# Altium project Control-Board-v4.0.PrjPcb (part 1 of 2)
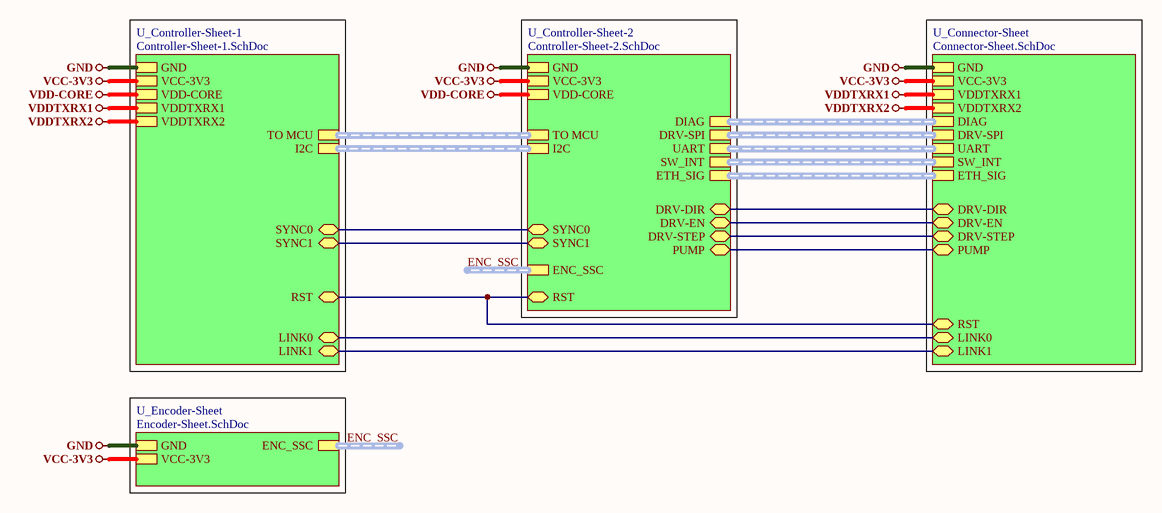
[diagram p0: Top-Sheet.SchDoc]
5 sheets, 81 parts. Net scope: hierarchical (ports join the sheet entries above them; power ports are global).
Board file: Control-Board-v4.0.PcbDoc
Sheets:
  Top-Sheet.SchDoc
    U_Controller-Sheet-1 = Controller-Sheet-1.SchDoc
    U_Controller-Sheet-2 = Controller-Sheet-2.SchDoc
    U_Encoder-Sheet = Encoder-Sheet.SchDoc
    U_Connector-Sheet = Connector-Sheet.SchDoc

## Sheet Top-Sheet.SchDoc
size A4; SheetNumber: 1; SheetTotal: 5

### Sub-sheets
U_Connector-Sheet = Connector-Sheet.SchDoc: VDDTXRX2, GND, VDDTXRX1, VCC-3V3, DIAG (harness DIAG), DRV-SPI (harness DRV-SPI), UART (harness UART), SW_INT (harness SW_INT), DRV-STEP (bidir), DRV-DIR (bidir), DRV-EN (bidir), PUMP (bidir), ETH_SIG (harness ETH_SIG), LINK0 (bidir), LINK1 (bidir), RST (bidir)
U_Controller-Sheet-1 = Controller-Sheet-1.SchDoc: GND, VCC-3V3, TO MCU (harness To MCU), I2C (harness I2C), VDDTXRX2, VDDTXRX1, RST (bidir), SYNC0 (bidir), SYNC1 (bidir), LINK0 (bidir), LINK1 (bidir), VDD-CORE
U_Controller-Sheet-2 = Controller-Sheet-2.SchDoc: ETH_SIG (harness ETH_SIG), ENC_SSC (harness ENC_SSC), SW_INT (harness SW_INT), TO MCU (harness To MCU), UART (harness UART), GND, VCC-3V3, I2C (harness I2C), SYNC0 (bidir), SYNC1 (bidir), RST (bidir), VDD-CORE, DIAG (harness DIAG), DRV-STEP (bidir), DRV-DIR (bidir), DRV-EN (bidir), DRV-SPI (harness DRV-SPI), PUMP (bidir)
U_Encoder-Sheet = Encoder-Sheet.SchDoc: GND, VCC-3V3, ENC_SSC (harness ENC_SSC)

### Nets
GND: sheet U_Controller-Sheet-1/GND, sheet U_Controller-Sheet-2/GND, sheet U_Encoder-Sheet/GND, sheet U_Connector-Sheet/GND
VCC-3V3: sheet U_Controller-Sheet-1/VCC-3V3, sheet U_Controller-Sheet-2/VCC-3V3, sheet U_Encoder-Sheet/VCC-3V3, sheet U_Connector-Sheet/VCC-3V3
VDD-CORE: sheet U_Controller-Sheet-1/VDD-CORE, sheet U_Controller-Sheet-2/VDD-CORE
VDDTXRX1: sheet U_Controller-Sheet-1/VDDTXRX1, sheet U_Connector-Sheet/VDDTXRX1
VDDTXRX2: sheet U_Controller-Sheet-1/VDDTXRX2, sheet U_Connector-Sheet/VDDTXRX2
DRV-DIR: sheet U_Controller-Sheet-2/DRV-DIR, sheet U_Connector-Sheet/DRV-DIR
DRV-EN: sheet U_Controller-Sheet-2/DRV-EN, sheet U_Connector-Sheet/DRV-EN
DRV-STEP: sheet U_Controller-Sheet-2/DRV-STEP, sheet U_Connector-Sheet/DRV-STEP
LINK0: sheet U_Controller-Sheet-1/LINK0, sheet U_Connector-Sheet/LINK0
LINK1: sheet U_Controller-Sheet-1/LINK1, sheet U_Connector-Sheet/LINK1
PUMP: sheet U_Controller-Sheet-2/PUMP, sheet U_Connector-Sheet/PUMP
RST: sheet U_Controller-Sheet-1/RST, sheet U_Controller-Sheet-2/RST, sheet U_Connector-Sheet/RST
SYNC0: sheet U_Controller-Sheet-1/SYNC0, sheet U_Controller-Sheet-2/SYNC0
SYNC1: sheet U_Controller-Sheet-1/SYNC1, sheet U_Controller-Sheet-2/SYNC1

### Buses and harness runs
harness ENC_SSC = sheet U_Controller-Sheet-2/ENC_SSC
harness ENC_SSC = sheet U_Encoder-Sheet/ENC_SSC
harness sheet U_Connector-Sheet/DIAG = sheet U_Controller-Sheet-2/DIAG
harness sheet U_Connector-Sheet/DRV-SPI = sheet U_Controller-Sheet-2/DRV-SPI
harness sheet U_Connector-Sheet/ETH_SIG = sheet U_Controller-Sheet-2/ETH_SIG
harness sheet U_Connector-Sheet/SW_INT = sheet U_Controller-Sheet-2/SW_INT
harness sheet U_Connector-Sheet/UART = sheet U_Controller-Sheet-2/UART
harness sheet U_Controller-Sheet-1/I2C = sheet U_Controller-Sheet-2/I2C
harness sheet U_Controller-Sheet-1/TO MCU = sheet U_Controller-Sheet-2/TO MCU

### Notes on the sheet
- File:
- Title:
- Date:
- Page
- Num:
- Total:
- Drawn By: Huzaifa Ali

## Sheet Controller-Sheet-1.SchDoc
size A4; SheetNumber: 2; SheetTotal: 5
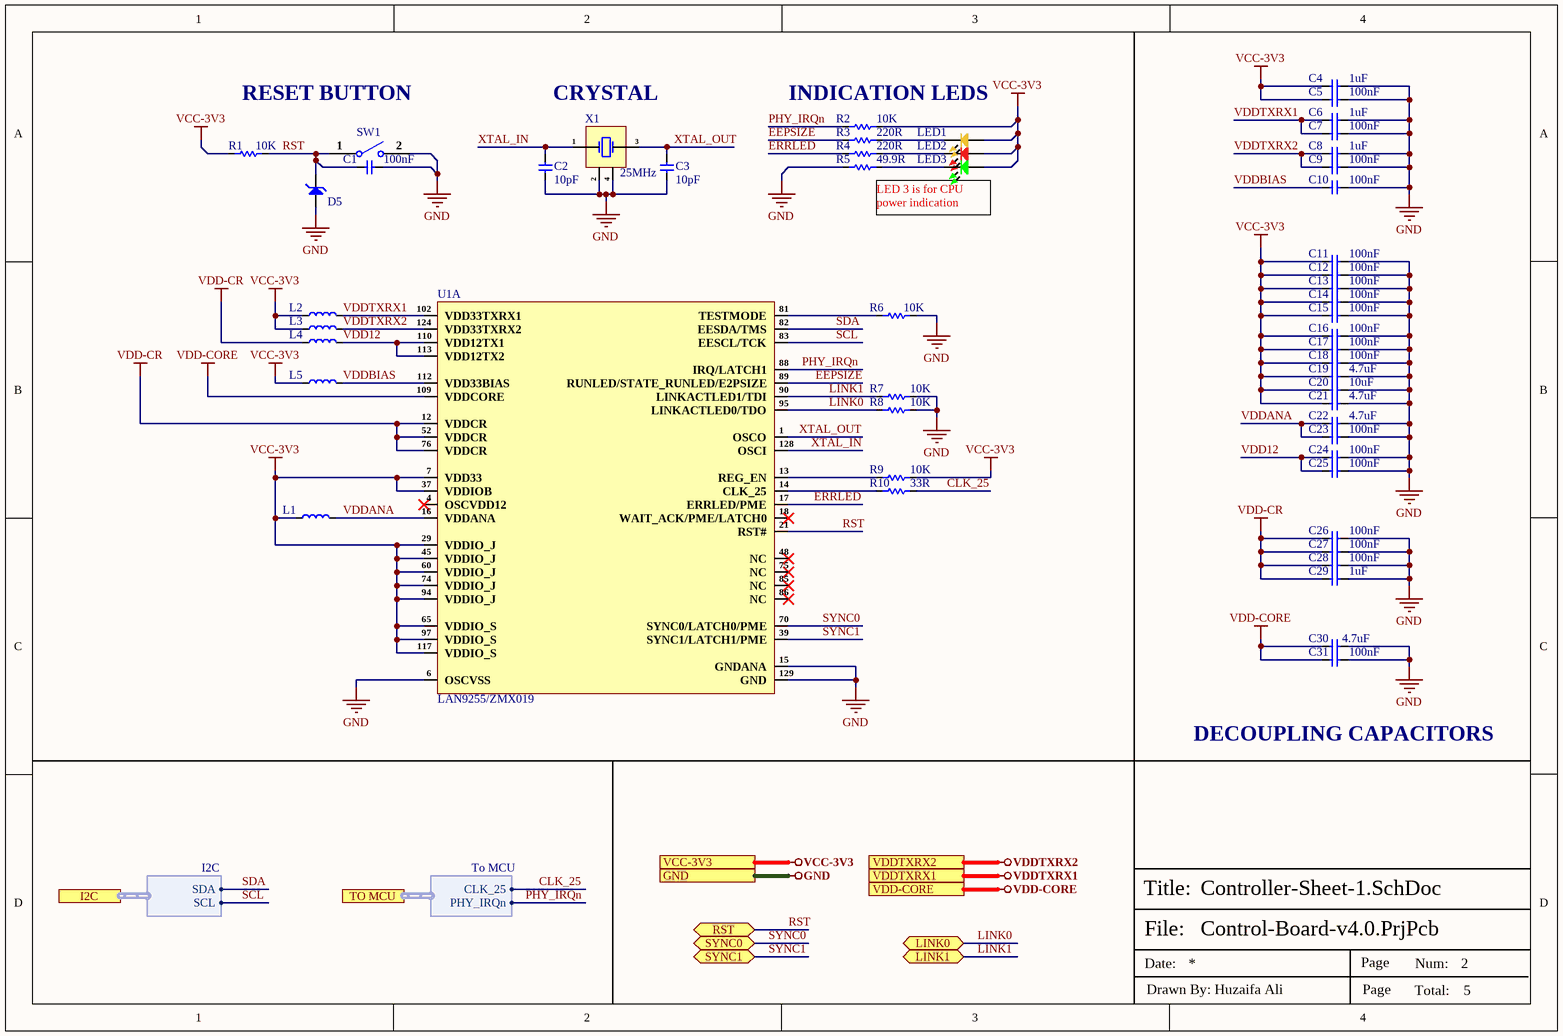
[diagram p1: Controller-Sheet-1.SchDoc]

### Parts
C1  100nF  [CAP-0201]
C2  10pF  [CAP-0201]
C3  10pF  [CAP-0201]
C4  1uF  [CAP-0201]
C5  100nF  [CAP-0201]
C6  1uF  [CAP-0201]
C7  100nF  [CAP-0201]
C8  1uF  [CAP-0201]
C9  100nF  [CAP-0201]
C10  100nF  [CAP-0201]
C11  100nF  [CAP-0201]
C12  100nF  [CAP-0201]
C13  100nF  [CAP-0201]
C14  100nF  [CAP-0201]
C15  100nF  [CAP-0201]
C16  100nF  [CAP-0201]
C17  100nF  [CAP-0201]
C18  100nF  [CAP-0201]
C19  4.7uF  [Cap-0402]
C20  10uF  [Cap-0402]
C21  4.7uF  [Cap-0402]
C22  4.7uF  [Cap-0402]
C23  100nF  [CAP-0201]
C24  100nF  [CAP-0201]
C25  100nF  [CAP-0201]
C26  100nF  [CAP-0201]
C27  100nF  [CAP-0201]
C28  100nF  [CAP-0201]
C29  1uF  [CAP-0201]
C30  4.7uF  [Cap-0402]
C31  100nF  [CAP-0201]
D5  PESDHC3D3V3U  [SOD-323]  (value not drawn)
L1  MLB1608-201P1A(f)  [IND-0603 (1608 Metric)]  (value not drawn)
L2  MLB1608-201P1A(f)  [IND-0603 (1608 Metric)]  (value not drawn)
L3  MLB1608-201P1A(f)  [IND-0603 (1608 Metric)]  (value not drawn)
L4  MLB1608-201P1A(f)  [IND-0603 (1608 Metric)]  (value not drawn)
L5  MLB1608-201P1A(f)  [IND-0603 (1608 Metric)]  (value not drawn)
LED1  Yellow  [LED-0603]  (value not drawn)
LED2  RED  [LED-0603]  (value not drawn)
LED3  Emerald  [LED-0603]  (value not drawn)
R1  10K  [Res-0201]
R2  10K  [Res-0201]
R3  220R  [Res-0201]
R4  220R  [Res-0201]
R5  49.9R  [Res-0201]
R6  10K  [Res-0201]
R7  10K  [Res-0201]
R8  10K  [Res-0201]
R9  10K  [Res-0201]
R10  33R  [Res-0402]
SW1  B3U-1000P  [B3U-1000P]  (value not drawn)
U1  LAN9255/ZMX019  [LAN9255/ZMX019]  (part A of 3)
X1  25MHz  [ABM10AIG-25.000MHZ-4Z-T3]

### Ports
GND (see Top-Sheet[1A], Connector-Sheet[3D], Controller-Sheet-2[3D], Encoder-Sheet[3D]), I2C (harness I2C, see Top-Sheet[2B], Controller-Sheet-2[1D]), LINK0 (bidir, see Top-Sheet[2C], Connector-Sheet[1D]), LINK1 (bidir, see Top-Sheet[2C], Connector-Sheet[1D]), RST (bidir, see Top-Sheet[2B], Connector-Sheet[1D], Controller-Sheet-2[3D]), SYNC0 (bidir, see Top-Sheet[2B], Controller-Sheet-2[3D]), SYNC1 (bidir, see Top-Sheet[2B], Controller-Sheet-2[3D]), TO MCU (harness To MCU, see Top-Sheet[2B], Controller-Sheet-2[1D]), VCC-3V3 (see Top-Sheet[1B], Connector-Sheet[3D], Controller-Sheet-2[3D], Encoder-Sheet[2D]), VDD-CORE (see Top-Sheet[1B], Controller-Sheet-2[3D]), VDDTXRX1 (see Top-Sheet[1B], Connector-Sheet[3D]), VDDTXRX2 (see Top-Sheet[1B], Connector-Sheet[3D])

### Harnesses
To MCU: CLK_25, PHY_IRQn
I2C: SDA, SCL

### Nets
GND: C1.2 C2.1 C3.1 C4.2 C5.2 C6.2 C7.2 C8.2 C9.2 C10.2 C11.2 C12.2 C13.2 C14.2 C15.2 C16.2 C17.2 C18.2 C19.2 C20.2 C21.2 C22.2 C23.2 C24.2 C25.2 C26.2 C27.2 C28.2 C29.2 C30.2 C31.2 D5.2(A) R5.1 R6.2 R7.2 R8.2 SW1.2 U1.6(OSCVSS) U1.15(GNDANA) U1.129(GND) X1.2(GND) X1.4(GND) ; port GND
VCC-3V3: C4.1 C5.1 C11.1 C12.1 C13.1 C14.1 C15.1 C16.1 C17.1 C18.1 C19.1 C20.1 C21.1 L1.1 L2.1 L3.1 L5.1 LED1.1 LED2.1 LED3.1 R1.1 R2.2 R9.2 U1.7(VDD33) U1.29(VDDIO_J) U1.37(VDDIOB) U1.45(VDDIO_J) U1.60(VDDIO_J) U1.65(VDDIO_S) U1.74(VDDIO_J) U1.94(VDDIO_J) U1.97(VDDIO_S) U1.117(VDDIO_S) ; port VCC-3V3
VDD-CORE: C30.1 C31.1 U1.109(VDDCORE) ; port VDD-CORE
VDD-CR: C26.1 C27.1 C28.1 C29.1 L4.1 U1.12(VDDCR) U1.52(VDDCR) U1.76(VDDCR)
VDDTXRX1: C6.1 C7.1 L2.2 U1.102(VDD33TXRX1) ; port VDDTXRX1
VDDTXRX2: C8.1 C9.1 L3.2 U1.124(VDD33TXRX2) ; port VDDTXRX2
CLK_25: R10.2 ; port TO MCU.CLK_25
EEPSIZE: R3.1 U1.89(RUNLED/STATE_RUNLED/E2PSIZE)
ERRLED: R4.1 U1.17(ERRLED/PME)
LINK0: R8.1 U1.95(LINKACTLED0/TDO) ; port LINK0
LINK1: R7.1 U1.90(LINKACTLED1/TDI) ; port LINK1
PHY_IRQn: R2.1 U1.88(IRQ/LATCH1) ; port TO MCU.PHY_IRQn
RST: C1.1 D5.1(C) R1.2 SW1.1 U1.21(RST#) ; port RST
SCL: U1.83(EESCL/TCK) ; port I2C.SCL
SDA: U1.82(EESDA/TMS) ; port I2C.SDA
SYNC0: U1.70(SYNC0/LATCH0/PME) ; port SYNC0
SYNC1: U1.39(SYNC1/LATCH1/PME) ; port SYNC1
VDD12: C24.1 C25.1 L4.2 U1.110(VDD12TX1) U1.113(VDD12TX2)
VDDANA: C22.1 C23.1 L1.2 U1.16(VDDANA)
VDDBIAS: C10.1 L5.2 U1.112(VDD33BIAS)
XTAL_IN: C2.2 U1.128(OSCI) X1.1(OSC1)
XTAL_OUT: C3.2 U1.1(OSCO) X1.3(OSC2)
NetLED1_2: LED1.2 R3.2
NetLED2_2: LED2.2 R4.2
NetLED3_2: LED3.2 R5.2
NetR6_1: R6.1 U1.81(TESTMODE)
NetR9_1: R9.1 U1.13(REG_EN)
NetR10_1: R10.1 U1.14(CLK_25)

Not connected (* = marked no-connect by the designer): U1 4(OSCVDD12)* 18(WAIT_ACK/PME/LATCH0)* 48(NC)* 75(NC)* 85(NC)* 86(NC)*

### Notes on the sheet
- RESET BUTTON
- CRYSTAL
- INDICATION LEDS
- LED 3 is for CPU power indication
- DECOUPLING CAPACITORS
- File:
- Title:
- Date:
- Page
- Num:
- Total:
- Drawn By: Huzaifa Ali

### Library data of the parts
C1 C5 C7 C9-C18 C23-C28 C31 = CC0201KRX5R6BB104: CAP CER 0.1UF 10V X5R 0201; Manufacturer: Yageo; Tolerance: 10%; Supplier 1: Mouser; Manufacturer Part Number: CC0201KRX5R6BB104; RoHS: Yes; Category: Ceramic Capacitors; Stock 1: 824403; Pricing 1: 1=0.10000, 10=0.02400, 50=0.02400, 100=0.01900, 1000=0.01100, 10000=0.00900 (USD); Mount: Surface Mount; Case/Package: 0201; Case Code (Imperial): 0201; Case Code (Metric): 0603; Weight: 6E-06oz; Min Operating Temperature: -55°C; Max Operating Temperature: 85°C; Capacitance: 100nF; Dielectric: X5R; Voltage Rating (DC): 10V; Packaging: Tape and Reel; Termination: SMD/SMT; Resistor Type: Ceramic; Voltage Rating: 10V; Series: CC; Construction: Flat; Length: 0.6mm; Width: 0.012inch; Height: 0.3mm; Thickness: 0.013inch; Depth: 0.3mm; Radiation Hardening: No; Lead Free: Lead Free; Halogen Free: Halogen Free; RoHS Compliant: Yes; ComponentLink1URL: https://datasheet.ciiva.com/11587/upy-gphc-x5r-4v-to-50v-12-11587190.pdf?src-supplier=Avnet; ComponentLink1Description: https://datasheet.ciiva.com/11587/upy-gphc-x5r-4v-to-50v-12-11587190.pdf?src-supplier=Avnet; Supplier Part Number 1: 603-CC201KRX5R6BB104; LCSC Part Number: C190183
C2 C3 = CGA1A2C0G1E100D030BA: CAP CER 10PF 25V C0G 0201; Manufacturer: TDK; Item Type: Capacitor; Supplier 1: Digi-Key; Manufacturer Part Number: CGA1A2C0G1E100D030BA; RoHS: Yes; Category: Ceramic Capacitors; Stock 1: 28695; Pricing 1: 1=0.11000, 10=0.07900, 50=0.04340, 100=0.03540, 500=0.02530, 1000=0.01987, 2500=0.01807, 5000=0.01662 (USD); Mount: Surface Mount; Case/Package: 0201; Case Code (Imperial): 0201; Case Code (Metric): 0603; Weight: 6E-06oz; Min Operating Temperature: -55°C; Max Operating Temperature: 125°C; Packaging: Tape and Reel; Capacitance: 10pF; Voltage Rating: 25V; Termination: SMD/SMT; Voltage Rating (DC): 25V; Package Quantity: 1; Dielectric: C0G; Resistor Type: Ceramic; Series: CGA; Length: 0.6mm; Width: 0.3mm; Height: 0.3mm; Thickness: 0.013inch; Depth: 0.3mm; Ratings: AEC-Q200; RoHS Compliant: Yes; ComponentLink1URL: https://datasheet.ciiva.com/24220/cga1a2c0g1e100d030ba-271838-24220873.pdf?src-supplier=Mouser; ComponentLink1Description: https://datasheet.ciiva.com/24220/cga1a2c0g1e100d030ba-271838-24220873.pdf?src-supplier=Mouser; Supplier Part Number 1: 445-9023-1-ND; LCSC Part Number: C2168728
C4 C6 C8 C29 = CC0201MRX5R6BB105: CAP CER 1UF 10V X5R 0201; Manufacturer: Yageo; Item Type: Capacitor; Supplier: Digi-Key; Supplier Part Number: 311-3474-1-ND; Manufacturer Part Number: CC0201MRX5R6BB105; RoHS: Yes; Category: Ceramic Capacitors; Stock: 772400; Pricing: 1=0.19, 10=0.135, 50=0.0764, 100=0.0633, 500=0.04436, 1000=0.03672, 2500=0.03418, 5000=0.03127 (USD); ComponentLink1URL: https://datasheet.octopart.com/CC0201MRX5R6BB105-Yageo-datasheet-158238148.pdf?src-supplier=Farnell; ComponentLink1Description: https://datasheet.octopart.com/CC0201MRX5R6BB105-Yageo-datasheet-158238148.pdf?src-supplier=Farnell; ComponentLink2URL: http://www.yageo.com/documents/recent/UPY-GPHC_X5R_4V-to-50V_25.pdf?src-supplier=Digi-Key; ComponentLink2Description: http://www.yageo.com/documents/recent/UPY-GPHC_X5R_4V-to-50V_25.pdf?src-supplier=Digi-Key; ComponentLink3URL: https://datasheet.octopart.com/CC0201MRX5R6BB105-Yageo-datasheet-137700082.pdf?src-supplier=Future+Electronics; ComponentLink3Description: https://datasheet.octopart.com/CC0201MRX5R6BB105-Yageo-datasheet-137700082.pdf?src-supplier=Future+Electronics; LCSC Part Number: C605210
C19 C21 C22 C30 = CC0402KRX5R6BB475: CAP CER 4.7UF 10V X5R 0402; Manufacturer: Yageo; Tolerance: 10%; Supplier 1: Farnell; Manufacturer Part Number: CC0402KRX5R6BB475; RoHS: Yes; Category: Ceramic Capacitors; Stock 1: 20000; Pricing 1: 10000=0.02310, 50000=0.02100 (GBP); Mount: Surface Mount; Case/Package: 0402; Case Code (Imperial): 0402; Case Code (Metric): 1005; Min Operating Temperature: -55°C; Max Operating Temperature: 85°C; Packaging: Cut Tape; Capacitance: 4.7uF; Voltage Rating: 10V; RoHS Compliant: Yes; ComponentLink1URL: http://www.yageo.com/documents/recent/UPY-GPHC_X5R_4V-to-50V_25.pdf?src-supplier=Digi-Key; ComponentLink1Description: http://www.yageo.com/documents/recent/UPY-GPHC_X5R_4V-to-50V_25.pdf?src-supplier=Digi-Key; Supplier Part Number 1: 3871698; LCSC Part Number: C326586
C20 = CL05A106MP5NUNC: CAP CER 10UF 10V X5R 0402; Manufacturer: Samsung; Tolerance: 20%; Item Type: Capacitor; Supplier 1: Avnet; Manufacturer Part Number: CL05A106MP5NUNC; RoHS: Yes; Category: Ceramic Capacitors; Stock 1: 1729850; Pricing 1: 10000=0.02537 (USD); Mount: Surface Mount; Case/Package: 0402; Case Code (Metric): 1005; Case Code (Imperial): 0402; Contact Plating: Tin; Min Operating Temperature: -55°C; Max Operating Temperature: 85°C; Package Quantity: 1; Packaging: Tape and Reel; Capacitance: 10uF; Voltage Rating: 10V; Dielectric: X5R; Termination: Wraparound; Series: CL; Construction: Flat; Length: 1mm; Width: 0.02inch; Thickness: 0.028inch; Depth: 0.5mm; Radiation Hardening: No; Lead Free: Lead Free; RoHS Compliant: Yes; ComponentLink1URL: https://datasheet.ciiva.com/25721/cl05a106mp5nunc-25721584.pdf?src-supplier=Digi-Key; ComponentLink1Description: https://datasheet.ciiva.com/25721/cl05a106mp5nunc-25721584.pdf?src-supplier=Digi-Key; ComponentLink2URL: https://datasheet.ciiva.com/26838/getdatasheetpartid-745310-26838170.pdf?src-supplier=Verical; ComponentLink2Description: https://datasheet.ciiva.com/26838/getdatasheetpartid-745310-26838170.pdf?src-supplier=Verical; Supplier Part Number 1: CL05A106MP5NUNC; LCSC Part Number: C315248
D5 = PESDHC3D3V3U: 15A@8/20us 9V 5V 3.3V Unidirectional SOD-323 TVS ROHS; Manufacturer: Shanghai Prisemi Elec; Item Type: Diode; Manufacturer Part Number: PESDHC3D3V3U; Package: SOD-323; LCSC Part Number: C496538; ComponentLink1Description: LCSC; ComponentLink1URL: https://www.lcsc.com/product-detail/TVS_Shanghai-Prisemi-Elec-PESDHC3D3V3U_C496538.html
L1-L5 = MLB1608-201P1A(f): 200Ω @ 100MHz 1 1A 300mΩ 0603 Ferrite Beads; Manufacturer: Meled; Number of Lines: 1; Impedance @ Frequency: 200Ω @ 100MHz; Current Rating (Max): 1A; DC Resistance (DCR) (Max): 300mΩ; ComponentLink1Description: LCSC; ComponentLink1URL: https://www.lcsc.com/product-detail/Ferrite-Beads_Meled-MLB1608-201P1A-f_C45316.html
LED1 = NCD0603Y2: yellow 0603 Light Emitting Diodes (LED) ROHS; Manufacturer: Foshan NationStar Optoelectronics; Manufacturer Part Number: NCD0603Y2; Package: 0603; LCSC Part Number: C89811; Item Type: LED; ComponentLink1Description: LCSC; ComponentLink1URL: https://www.lcsc.com/product-detail/Light-Emitting-Diodes-LED_Foshan-NationStar-Optoelectronics-NCD0603Y2_C89811.html
LED2 = NCD0603R3: RED LED 0603 Light Emitting Diodes; Manufacturer: Foshan NationStar Optoelectronics; Manufacturer Part Number: NCD0603R3; Package: 0603; Item Type: LED; LCSC Part Number: C3151730; ComponentLink1Description: LCSC; ComponentLink1URL: https://www.lcsc.com/product-detail/Light-Emitting-Diodes-LED_Foshan-NationStar-Optoelectronics-NCD0603R3_C3151730.html
LED3 = NCD0603G2: Emerald 0603 Light Emitting Diodes (LED) ROHS; Manufacturer: Foshan NationStar Optoelectronics; Manufacturer Part Number: NCD0603G2; Package: 0603; LCSC Part Number: C87326; Item Type: LED; ComponentLink1Description: LCSC; ComponentLink1URL: https://www.lcsc.com/product-detail/Light-Emitting-Diodes-LED_Foshan-NationStar-Optoelectronics-NCD0603G2_C87326.html
R1 R2 R6-R9 = RC0201FR-0710KL: RES SMD 10K OHM 1% 1/20W 0201; Manufacturer: Yageo; Item Type: Resistor; Manufacturer Part Number: RC0201FR-0710KL; Package: 0201; ComponentLink7Description: LCSC; ComponentLink7URL: https://www.lcsc.com/product-detail/Chip-Resistor-Surface-Mount_YAGEO-RC0201FR-0710KL_C106225.html; LCSC Part Number: C106225
R3 R4 = RC0201FR-07220RL: RES 220 OHM 1% 1/20W 0201; Manufacturer: Yageo; Temperature Coefficient: 200ppm/°C; Power Rating: 50mW; Voltage Rating: 25V; Supplier 1: Digi-Key; Manufacturer Part Number: RC0201FR-07220RL; RoHS: Yes; Category: Chip SMD Resistors; Stock 1: 189347; Pricing 1: 1=0.10000, 10=0.03600, 100=0.01480, 1000=0.00665, 2500=0.00577, 5000=0.00477 (USD); Case/Package: 0201; Contact Plating: Tin,Matte; Case Code (Imperial): 0201; Case Code (Metric): 0603; Min Operating Temperature: -55°C; Max Operating Temperature: 125°C; Resistance: 220R; Tolerance: 1%; Resistor Type: Thick Film; Packaging: Tape and Reel; Features: Moisture Resistant; Max Power Dissipation: 50mW; Number of Terminations: 2; Termination: SMD/SMT; Length: 0.6mm; Width: 0.012inch; Height: 0.01inch; Depth: 0.3mm; Radiation Hardening: No; REACH SVHC: Unknown; Military Standard: Not; ComponentLink1URL: https://datasheet.ciiva.com/7672/1563626-7672213.pdf?src-supplier=Element14; ComponentLink1Description: https://datasheet.ciiva.com/7672/1563626-7672213.pdf?src-supplier=Element14; ComponentLink2URL: https://datasheet.ciiva.com/8886/pyu-rc0201-51-rohs-l-8-8886758.pdf?src-supplier=Avnet; ComponentLink2Description: https://datasheet.ciiva.com/8886/pyu-rc0201-51-rohs-l-8-8886758.pdf?src-supplier=Avnet; ComponentLink3URL: https://datasheet.ciiva.com/16855/pyu-rc0201-51-rohs-l-8-16855847.pdf?src-supplier=Avnet+Europe; ComponentLink3Description: https://datasheet.ciiva.com/16855/pyu-rc0201-51-rohs-l-8-16855847.pdf?src-supplier=Avnet+Europe; ComponentLink4URL: https://datasheet.ciiva.com/28393/pyu-rc0201-51-rohs-l-8-28393063.pdf?src-supplier=Avnet+Europe; ComponentLink4Description: https://datasheet.ciiva.com/28393/pyu-rc0201-51-rohs-l-8-28393063.pdf?src-supplier=Avnet+Europe; Supplier Part Number 1: YAG2509CT-ND; LCSC Part Number: C274342
R5 = RC0201FR-0749R9L: RES SMD 49.9 OHM 1% 1/20W 0201; Manufacturer: Yageo; Power Rating: 50mW; Voltage Rating: 25V; Temperature Coefficient: 200ppm/°C; Item Type: Resistor; Supplier 1: Avnet; Manufacturer Part Number: RC0201FR-0749R9L; RoHS: Yes; Category: Chip SMD Resistors; Stock 1: 1020000; Pricing 1: 10000=0.00128 (USD); Case/Package: 0201; Case Code (Imperial): 0201; Case Code (Metric): 0603; Size Code: 0201; Min Operating Temperature: -55°C; Max Operating Temperature: 125°C; Packaging: Tape and Reel; Resistance: 49.9R; Tolerance: 1%; Resistor Type: Thick Film; Number of Terminations: 2; Termination: SMD/SMT; Max Power Dissipation: 50mW; Features: Moisture Resistant; Series: RC; Construction: Rectangular; Length: 0.6mm; Width: 0.012inch; Height: 0.01inch; Depth: 0.3mm; Military Standard: Not; Lead Free: Lead Free; RoHS Compliant: Yes; ComponentLink1URL: http://www.yageo.com/documents/recent/PYu-RC0201_51_RoHS_L_(8).pdf?src-supplier=Mouser; ComponentLink1Description: http://www.yageo.com/documents/recent/PYu-RC0201_51_RoHS_L_(8).pdf?src-supplier=Mouser; ComponentLink2URL: http://www.yageo.com/documents/recent/PYu-RC0201_51_RoHS_L_(8).pdf?src-supplier=Future+Electronics; ComponentLink2Description: http://www.yageo.com/documents/recent/PYu-RC0201_51_RoHS_L_(8).pdf?src-supplier=Future+Electronics; ComponentLink3URL: http://www.yageo.com/documents/recent/PYu-RC_Group_51_RoHS_L_10.pdf?src-supplier=Digi-Key; ComponentLink3Description: http://www.yageo.com/documents/recent/PYu-RC_Group_51_RoHS_L_10.pdf?src-supplier=Digi-Key; ComponentLink4URL: http://www.yageo.com/documents/recent/PYu-RC_Group_51_RoHS_L_9.pdf?src-supplier=Digi-Key; ComponentLink4Description: http://www.yageo.com/documents/recent/PYu-RC_Group_51_RoHS_L_9.pdf?src-supplier=Digi-Key; Supplier Part Number 1: RC0201FR-0749R9L; LCSC Part Number: C155744
R10 = RC0402FR-0733RL: RES 33 OHM 1% 1/16W 0402; Manufacturer: Yageo; Power Rating: 62.5mW; Voltage Rating: 50V; Temperature Coefficient: 100ppm/°C; Max Power Dissipation: 63mW; Supplier 1: Mouser; Manufacturer Part Number: RC0402FR-0733RL; RoHS: Yes; Category: Chip SMD Resistors; Stock 1: 1843488; Pricing 1: 1=0.10000, 10=0.01200, 50=0.01200, 100=0.00500, 1000=0.00300, 10000=0.00100 (USD); Case/Package: 0402; Number of Pins: 2; Case Code (Imperial): 0402; Case Code (Metric): 1005; Size Code: 0402; Min Operating Temperature: -55°C; Max Operating Temperature: 155°C; Resistor Type: Thick Film; Resistance: 33R; Tolerance: 1%; Packaging: Tape and Reel; Voltage Rating (DC): 50V; Package Quantity: 10000; Termination: SMD/SMT; Features: Moisture Resistant; Series: RC; Number of Terminations: 2; Resistance Tolerance: 1%; Construction: Rectangular; Technology: THICK FILM; Length: 1mm; Width: 0.5mm; Height: 0.35mm; Depth: 0.5mm; RoHS Compliant: Yes; REACH SVHC: Unknown; Military Standard: Not; Lead Free: Lead Free; ComponentLink1URL: https://datasheet.ciiva.com/11819/0900766b80c66297-11819487.pdf?src-supplier=RSComponents; ComponentLink1Description: https://datasheet.ciiva.com/11819/0900766b80c66297-11819487.pdf?src-supplier=RSComponents; ComponentLink2URL: https://datasheet.ciiva.com/24070/pyu-rc0402-51-rohs-l-6-r-8721-24070077.pdf?src-supplier=Mouser; ComponentLink2Description: https://datasheet.ciiva.com/24070/pyu-rc0402-51-rohs-l-6-r-8721-24070077.pdf?src-supplier=Mouser; ComponentLink3URL: https://datasheet.ciiva.com/7849/1018594-7849967.pdf?src-supplier=Element14; ComponentLink3Description: https://datasheet.ciiva.com/7849/1018594-7849967.pdf?src-supplier=Element14; ComponentLink4URL: https://datasheet.ciiva.com/7849/1018594-7849966.pdf?src-supplier=Element14; ComponentLink4Description: https://datasheet.ciiva.com/7849/1018594-7849966.pdf?src-supplier=Element14; ComponentLink5URL: https://datasheet.ciiva.com/15189/getdatasheetpartid-329253-15189431.pdf?src-supplier=Verical; ComponentLink5Description: https://datasheet.ciiva.com/15189/getdatasheetpartid-329253-15189431.pdf?src-supplier=Verical; ComponentLink6URL: https://datasheet.ciiva.com/17070/pyu-rc0402-51-rohs-l-6-r-17070335.pdf?src-supplier=Future+Electronics; ComponentLink6Description: https://datasheet.ciiva.com/17070/pyu-rc0402-51-rohs-l-6-r-17070335.pdf?src-supplier=Future+Electronics; Supplier Part Number 1: 603-RC0402FR-0733RL; LCSC Part Number: C138002
SW1 = B3U-1000P: SWITCH TACTILE SPST-NO 0.05A 12V; Manufacturer: Omron; Mechanical Life: 200000Cycles; Operating Force: 1.5N; Throw Configuration: SPST; Current Rating: 50mA; Contact Resistance: 100mR; Illumination Type: Non-Illuminated,Illuminated; Switch Travel: 0.15mm; Switch Function: Off-Mom; Actuator Type: Standard; Actuator Length: 0.4mm; Ratings: Dust Proof,IP40; ComponentLink1URL: http://www.farnell.com/datasheets/60838.pdf?src-supplier=Farnell; ComponentLink1Description: http://www.farnell.com/datasheets/60838.pdf?src-supplier=Farnell; ComponentLink2URL: http://www.farnell.com/datasheets/60838.pdf?src-supplier=Element14; ComponentLink2Description: http://www.farnell.com/datasheets/60838.pdf?src-supplier=Element14; ComponentLink3URL: https://omronfs.omron.com/en_US/ecb/products/pdf/en-b3u.pdf?src-supplier=Digi-Key; ComponentLink3Description: https://omronfs.omron.com/en_US/ecb/products/pdf/en-b3u.pdf?src-supplier=Digi-Key; ComponentLink4URL: http://www.omron.com/ecb/products/pdf/en-b3u.pdf?src-supplier=Digi-Key; ComponentLink4Description: http://www.omron.com/ecb/products/pdf/en-b3u.pdf?src-supplier=Digi-Key; ComponentLink5URL: https://www.distrelec.biz/Web/Downloads/he/et/B3U_eng_datasheet.pdf?mime=application%2Fpdf&src-supplier=Distrelec; ComponentLink5Description: https://www.distrelec.biz/Web/Downloads/he/et/B3U_eng_datasheet.pdf?mime=application%2Fpdf&src-supplier=Distrelec; ComponentLink6URL: http://www.onlinecomponents.com/productFiles/mf-OM/en-b3u.pdf?src-supplier=Onlinecomponents.com; ComponentLink6Description: http://www.onlinecomponents.com/productFiles/mf-OM/en-b3u.pdf?src-supplier=Onlinecomponents.com; Supplier 1: Digi-Key; Manufacturer Part Number: B3U-1000P; Stock 1: 116454; Pricing 1: 1=1, 10=0.961, 25=0.9064, 50=0.7976, 100=0.7251, 250=0.68888, 500=0.67074, 1000=0.52571 (USD); Mount: Surface Mount; Weight: 0.000776oz; Contact Material: Silver; Min Operating Temperature: -25°C; Max Operating Temperature: 70°C; Packaging: Tape and Reel; Voltage Rating (DC): 12V; Package Quantity: 1; Max Current Rating: 50mA; Termination: SMD/SMT; Orientation: Straight; Max Voltage Rating (DC): 12V; Electrical Life: 200000Cycles; Insulation Resistance: 100MR; Contact Current Rating: 50mA; Length: 4mm; Height: 1.2mm; Depth: 2.5mm; Width: 3mm; REACH SVHC: Unknown; Lead Free: Lead Free; ComponentLink7URL: https://www.verical.com/server-webapp/html/getDatasheet?partID=552554&src-supplier=Verical; ComponentLink7Description: https://www.verical.com/server-webapp/html/getDatasheet?partID=552554&src-supplier=Verical; ComponentLink8URL: http://www.farnell.com/datasheets/1685550.pdf?src-supplier=Element14; ComponentLink8Description: http://www.farnell.com/datasheets/1685550.pdf?src-supplier=Element14; ComponentLink9URL: http://www.farnell.com/datasheets/2610940.pdf?src-supplier=Farnell; ComponentLink9Description: http://www.farnell.com/datasheets/2610940.pdf?src-supplier=Farnell; ComponentLink10URL: https://www.alliedelec.com/m/d/4c8a9ef82804fc3c241a13c1e298fd73.pdf?src-supplier=Allied+Electronics; ComponentLink10Description: https://www.alliedelec.com/m/d/4c8a9ef82804fc3c241a13c1e298fd73.pdf?src-supplier=Allied+Electronics; Supplier Part Number 1: SW1020DKR-ND; LCSC Part Number: C231329; Item Type: Switch
U1 = LAN9255/ZMX019: IC ETHERCAT SLAVE CONTROLLER; Manufacturer: Microchip; Manufacturer Part Number: LAN9255-I/ZMX019; Supplier 1: Digi-Key; Stock 1: 70; Pricing 1: 1=17.76000, 25=16.18480 (USD); Supplier Part Number 1: 150-LAN9255-I/ZMX019-ND
X1 = ABM10AIG-25.000MHZ-4Z-T3: CRYSTAL 25.0000MHZ 10PF SMD; ESR (Equivalent Series Resistance): 60R; Frequency Stability: 50ppm; Frequency Tolerance: 30ppm; LCSC Part Number: C1985447; Item Type: Crystal; ComponentLink1Description: LCSC; Supplier: Future Electronics; Supplier Part Number: 4127685; RoHS: Yes; Category: Crystals; Stock: 6000; Pricing: 3000=0.41, 6000=0.4, 9000=0.395, 12000=0.39, 15000=0.38 (USD); Mounting Technology: Surface Mount; Case/Package: SMD/SMT; Min Operating Temperature: -40°C; Max Operating Temperature: 125°C; Packaging: Cut Tape; Frequency: 25MHz; Load Capacitance: 10pF; Series: ABM10AIG; Ratings: AEC-Q200; RoHS Compliant: Yes; ComponentLink2URL: http://www.mouser.com/ds/2/3/ABM10AIG-783578.pdf?src-supplier=Mouser; ComponentLink2Description: http://www.mouser.com/ds/2/3/ABM10AIG-783578.pdf?src-supplier=Mouser; ComponentLink3URL: https://abracon.com/AIGcrystals/ABM10AIG.pdf?src-supplier=Digi-Key; ComponentLink3Description: https://abracon.com/AIGcrystals/ABM10AIG.pdf?src-supplier=Digi-Key; ComponentLink4URL: https://abracon.com/Support/flyer/AutoGrade-AIG-Crystals.pdf?src-supplier=Digi-Key; ComponentLink4Description: https://abracon.com/Support/flyer/AutoGrade-AIG-Crystals.pdf?src-supplier=Digi-Key